# Altium schematic sheet MCU_WASH_MACHINE.SchDoc (part 2 of 3)
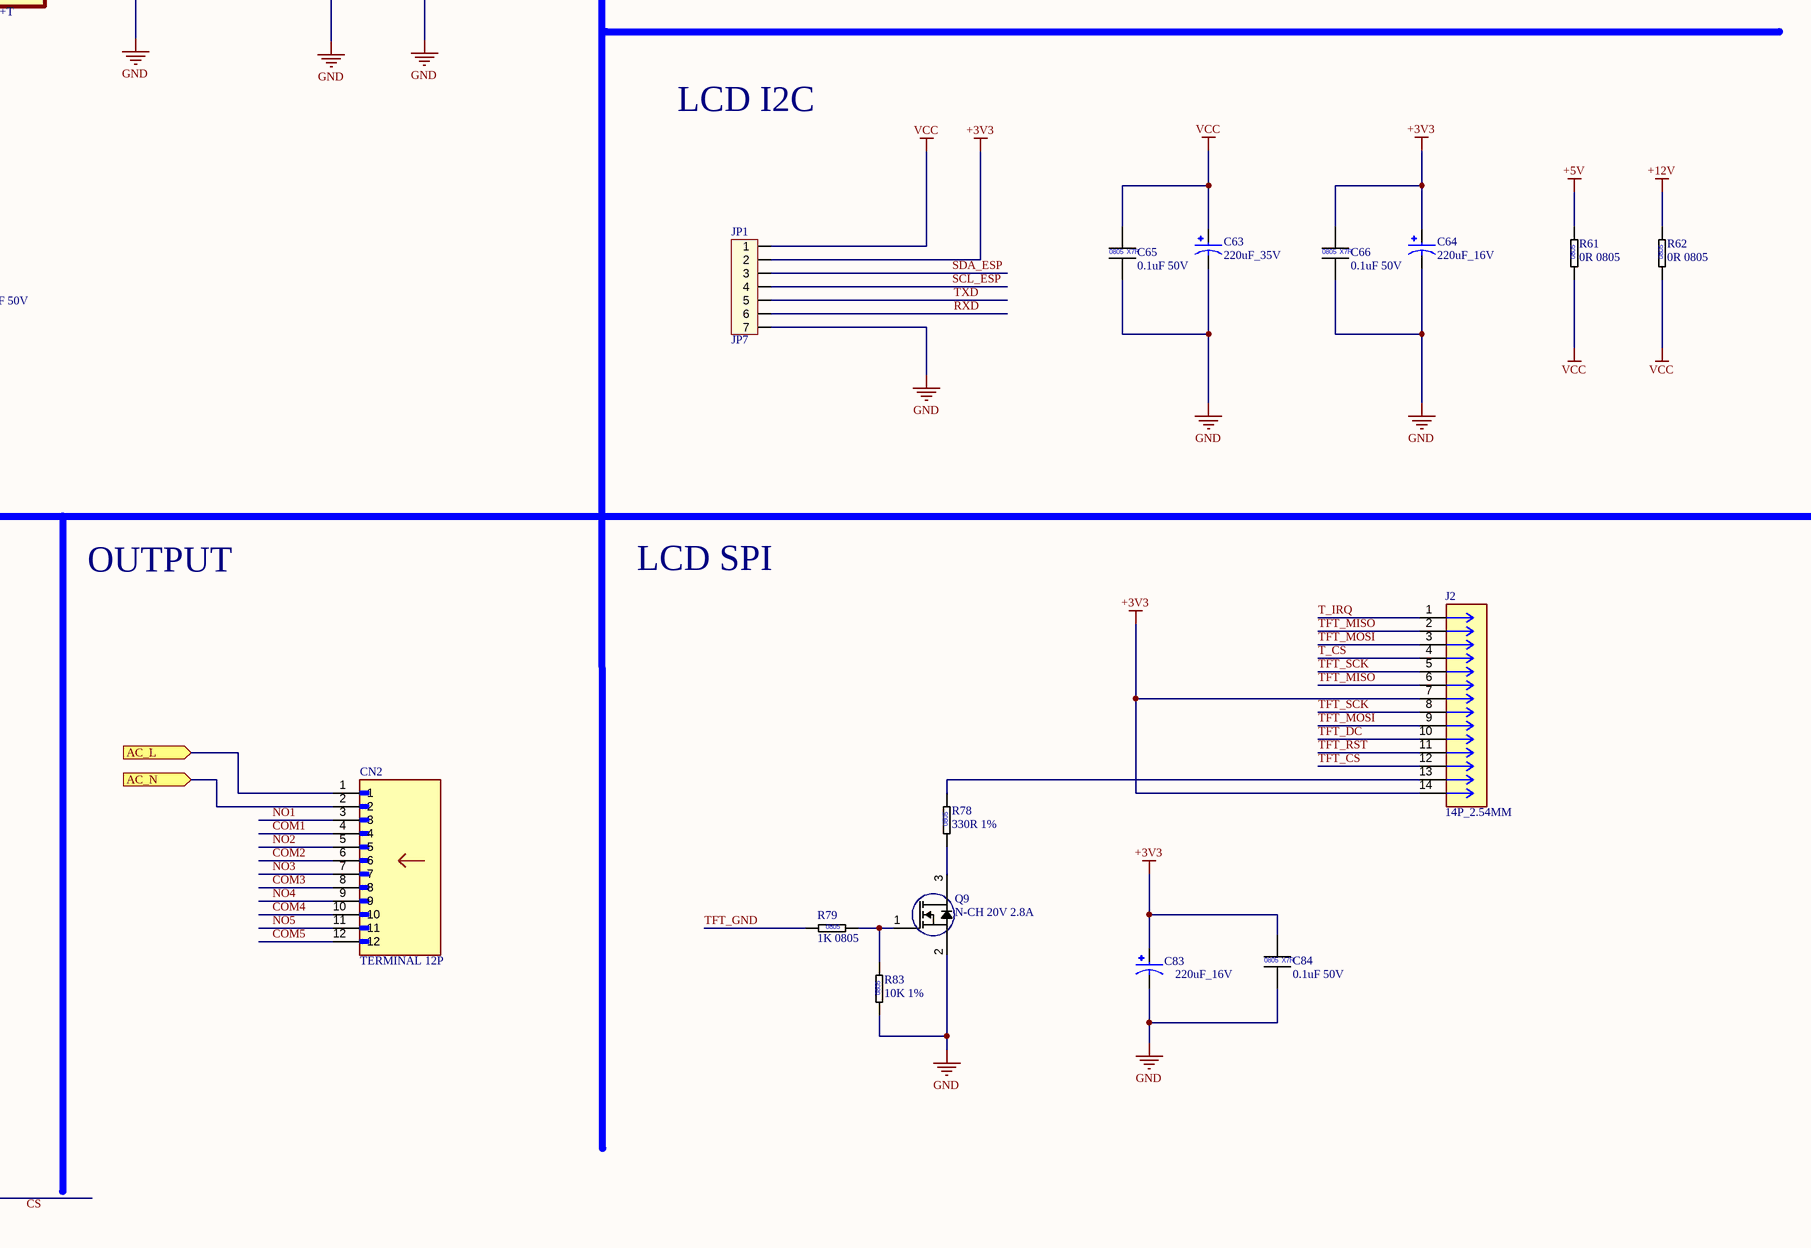
[diagram p8: MCU_WASH_MACHINE.SchDoc, bottom column 4 of 4]
## Library data of the parts
AT1 = Antenna_IPEX: Antenna
BH1 = BATT_HOLDER_SMD; BATTERY HOLDER COIN 12.5MM; 1056: Battery Holder, SMT, 1 Coin Cell, 12mm, Plastic, UL94V-0 | Keystone Electronics 1056; Manufacturer Part Number: 1056; Number of Batteries: 1; LIBRARY MADE BY: MR. XUAN SIEU; Supplier 1: DigiKey; Manufacturer: Keystone; RoHS: Compliant; Category: Batteries and Accessories; Stock 1: 79944; Pricing 1: 1=1.1, 1000=0.41, 2500=0.38, 5000=0.35 (USD); Color: Black; Lead Free: Lead Free; Lifecycle Status: Production; Max Operating Temperature: 145°C; Min Operating Temperature: -50°C; Mount: PCB, Surface Mount; Number of Cells: 1; REACH SVHC: Yes; Termination: SMD/SMT; ComponentLink1URL: https://datasheet.octopart.com:443/1056-Keystone-datasheet-15715033.pdf?src-supplier=Future+Electronics; ComponentLink1Description: https://datasheet.octopart.com:443/1056-Keystone-datasheet-15715033.pdf?src-supplier=Future+Electronics; ComponentLink2URL: https://datasheet.octopart.com:443/1056-Keystone-datasheet-8326175.pdf?src-supplier=Future+Electronics; ComponentLink2Description: https://datasheet.octopart.com:443/1056-Keystone-datasheet-8326175.pdf?src-supplier=Future+Electronics; ComponentLink3URL: https://datasheet.octopart.com:443/1056-Keystone-datasheet-137916583.pdf?src-supplier=LKR; ComponentLink3Description: https://datasheet.octopart.com:443/1056-Keystone-datasheet-137916583.pdf?src-supplier=LKR; ComponentLink4URL: https://datasheet.octopart.com:443/1056-Keystone-datasheet-137320296.pdf?src-supplier=Sager+Electronics; ComponentLink4Description: https://datasheet.octopart.com:443/1056-Keystone-datasheet-137320296.pdf?src-supplier=Sager+Electronics; ComponentLink5URL: https://datasheet.octopart.com:443/1056-Keystone-datasheet-62112666.pdf?src-supplier=RS+(Formerly+Allied+Electronics); ComponentLink5Description: https://datasheet.octopart.com:443/1056-Keystone-datasheet-62112666.pdf?src-supplier=RS+(Formerly+Allied+Electronics); ComponentLink6URL: https://datasheet.octopart.com:443/1056-Keystone-datasheet-21202752.pdf?src-supplier=Newark; ComponentLink6Description: https://datasheet.octopart.com:443/1056-Keystone-datasheet-21202752.pdf?src-supplier=Newark; ComponentLink7URL: https://datasheet.octopart.com:443/1056-Keystone-datasheet-17577351.pdf?src-supplier=TME; ComponentLink7Description: https://datasheet.octopart.com:443/1056-Keystone-datasheet-17577351.pdf?src-supplier=TME; ComponentLink8URL: https://datasheet.octopart.com:443/1056-Keystone-datasheet-176783336.pdf?src-supplier=SOS+electronic; ComponentLink8Description: https://datasheet.octopart.com:443/1056-Keystone-datasheet-176783336.pdf?src-supplier=SOS+electronic; Supplier Part Number 1: 36-1056-ND; LINK VIET NAM: https://linhkien.cxtvn.com/1651-de-pin-cr1220-3v-han-dan.html; LINK ORIGINAL: https://www.digikey.com/en/products/detail/keystone-electronics/1056/2020198
C16 = CAP_CER_SMD; 10PF 50V C0G/NP0 0805 2.5%: Cap Ceramic 10pF 50V C0G 0.25pF Pad SMD 0805 125°C T/R; Manufacturer: Samsung Electro-Mechanics; Manufacturer Part Number: CL21C100CBANNNC; Temperature Coefficient: 30ppm/°C; Tolerance: 5%; LIBRARY MADE BY: MR. XUAN SIEU; Supplier 1: DigiKey; RoHS: Compliant; Category: Ceramic Capacitors; Stock 1: 78846; Pricing 1: 1=0.1, 10=0.044, 50=0.0302, 100=0.026, 500=0.0169, 1000=0.01376 (USD); Capacitance: 10pF; Case/Package: 0805; Case Code (Imperial): 0805; Case Code (Metric): 2012; China RoHS: Compliant; Depth: 1.25mm; Dielectric: C0G; Dielectric Material: Ceramic; Height: 650µm; Length: 2mm; Lifecycle Status: Production; Material: Ceramic; Max Operating Temperature: 125°C; Min Operating Temperature: -55°C; Mount: Surface Mount; Number of Terminals: 2; Radiation Hardening: No; REACH SVHC: Yes; Schedule B: 8532240020, 8532240020|8532240020, 8532240020|8532240020|8532240020, 8532240020|8532240020|8532240020|8532240020; Thickness: 762µm; Voltage: 50V; Voltage Rating: 50V; Voltage Rating (DC): 50V; Width: 1.25mm; ComponentLink1URL: https://datasheet.octopart.com:443/CL21C100CBANNNC-Samsung-Electro-Mechanics-datasheet-136551476.pdf?src-supplier=IHS; ComponentLink1Description: https://datasheet.octopart.com:443/CL21C100CBANNNC-Samsung-Electro-Mechanics-datasheet-136551476.pdf?src-supplier=IHS; ComponentLink2URL: https://datasheet.octopart.com:443/CL21C100CBANNNC-Samsung-Electro-Mechanics-datasheet-149066775.pdf?src-supplier=Future+Electronics; ComponentLink2Description: https://datasheet.octopart.com:443/CL21C100CBANNNC-Samsung-Electro-Mechanics-datasheet-149066775.pdf?src-supplier=Future+Electronics; ComponentLink3URL: https://datasheet.octopart.com:443/CL21C100CBANNNC-Samsung-Electro-Mechanics-datasheet-110334009.pdf?src-supplier=Future+Electronics; ComponentLink3Description: https://datasheet.octopart.com:443/CL21C100CBANNNC-Samsung-Electro-Mechanics-datasheet-110334009.pdf?src-supplier=Future+Electronics; ComponentLink4URL: https://datasheet.octopart.com:443/CL21C100CBANNNC-Samsung-Electro-Mechanics-datasheet-101746655.pdf?src-supplier=Future+Electronics; ComponentLink4Description: https://datasheet.octopart.com:443/CL21C100CBANNNC-Samsung-Electro-Mechanics-datasheet-101746655.pdf?src-supplier=Future+Electronics; ComponentLink5URL: https://datasheet.octopart.com/CL21C100CBANNNC-Samsung-Electro-Mechanics-datasheet-97040617.pdf; ComponentLink5Description: https://datasheet.octopart.com/CL21C100CBANNNC-Samsung-Electro-Mechanics-datasheet-97040617.pdf; ComponentLink6URL: https://datasheet.octopart.com/CL21C100CBANNNC-Samsung-Electro-Mechanics-datasheet-8324245.pdf; ComponentLink6Description: https://datasheet.octopart.com/CL21C100CBANNNC-Samsung-Electro-Mechanics-datasheet-8324245.pdf; ComponentLink7URL: https://datasheet.octopart.com/General-Multilayer-Ceramic-Capacitors-Samsung-datasheet-family-111.pdf; ComponentLink7Description: https://datasheet.octopart.com/General-Multilayer-Ceramic-Capacitors-Samsung-datasheet-family-111.pdf; ComponentLink8URL: https://datasheet.octopart.com:443/CL21C100CBANNNC-Samsung-datasheet-8326407.pdf?src-supplier=TME; ComponentLink8Description: https://datasheet.octopart.com:443/CL21C100CBANNNC-Samsung-datasheet-8326407.pdf?src-supplier=TME; ComponentLink9URL: http://sigma.octopart.com:80/rohs_certificate/General-Multilayer-Ceramic-Capacitors-Samsung-family-110.pdf?src-supplier=Compliance+Statements; ComponentLink9Description: http://sigma.octopart.com:80/rohs_certificate/General-Multilayer-Ceramic-Capacitors-Samsung-family-110.pdf?src-supplier=Compliance+Statements; ComponentLink10URL: http://sigma.octopart.com:80/rohs_statement/General-Multilayer-Ceramic-Capacitors-Samsung-family-132.pdf?src-supplier=Compliance+Statements; ComponentLink10Description: http://sigma.octopart.com:80/rohs_statement/General-Multilayer-Ceramic-Capacitors-Samsung-family-132.pdf?src-supplier=Compliance+Statements; ComponentLink11URL: http://sigma.octopart.com:80/reach_statement/General-Multilayer-Ceramic-Capacitors-Samsung-family-133.pdf?src-supplier=Compliance+Statements; ComponentLink11Description: http://sigma.octopart.com:80/reach_statement/General-Multilayer-Ceramic-Capacitors-Samsung-family-133.pdf?src-supplier=Compliance+Statements; Supplier Part Number 1: 1276-2561-1-ND; LINK VIET NAM: https://linhkien.cxtvn.com/4872-tu-khong-phan-cuc-0805.html; LINK ORIGINAL: https://www.digikey.com/en/products/detail/samsung-electro-mechanics/CL21C100CBANNNC/3888219
C17 = CAP_CER_SMD; 33PF 50V C0G/NP0 0805 10%: Cap Ceramic 33pF (330) 50V C0G 10% SMD 0805 125C Paper T/R; Manufacturer Cross: KEMET; Manufacturer Part Number: C0805C330K5GACTU; Material: 4241ConductorMaterial; Dissipation Factor: 0.1%; Temperature Coefficient: 30ppm/°C; LIBRARY MADE BY: MR. XUAN SIEU; Supplier 1: Digikey; RoHS: Yes; Category: Ceramic Capacitors; Stock 1: 67884; Pricing 1: 1=0.1, 10=0.09, 100=0.0688, 1000=0.0514 (USD); Mount: Surface Mount; Case/Package: 0805; Case Code (Metric): 2012; Case Code (Imperial): 0805; Dielectric Material: 4241ConductorMaterial; Min Operating Temperature: -55°C; Max Operating Temperature: 125°C; Capacitance: 33pF; Package Quantity: 4000; Voltage Rating: 50V; Voltage Rating (DC): 50V; Tolerance: 10%; Packaging: Tape and Reel; Dielectric: C0G; Termination: SMD/SMT; Series: C; Construction: Flat; Length: 2mm; Width: 0.049inch; Height: 0.78mm; Thickness: 0.035inch; Lead Pitch: 0.75mm; Depth: 1.25mm; Radiation Hardening: No; Reach SVHC Compliant: No; RoHS Compliant: Yes; Lead Free: 5697LeadFree; ComponentLink1URL: https://datasheet.ciiva.com/26948/getdatasheetpartid-780465-26948481.pdf?src-supplier=Verical; ComponentLink1Description: https://datasheet.ciiva.com/26948/getdatasheetpartid-780465-26948481.pdf?src-supplier=Verical; ComponentLink2Description: Link Original; ComponentLink2URL: https://www.digikey.com/en/products/detail/kemet/C0805C330K5GACTU/2212525; ComponentLink3Description: Link Cross; ComponentLink3URL: https://www.lcsc.com/product-detail/Multilayer-Ceramic-Capacitors-MLCC-SMD-SMT_KEMET-C0805C330K5GACTU_C2169038.html?s_z=n_C0805C330K5GACTU; ComponentLink4Description: Link Viet Nam; ComponentLink4URL: https://linhkien.cxtvn.com/3499-tu-330-33pf-0805-50v-10c.html; Supplier Part Number 1: 399-C0805C330K5GACTUCT-ND
C18 C21 C35 C67 C71 C78 C82 = CAP_CER_SMD; 1000PF 50V X7R 0805 10%: 1000 pF (102,1nF) ±10% 50V Ceramic Capacitor X7R 0805 (2012 Metric),; Manufacturer Cross: KEMET; Manufacturer Part Number: C0805C102K5RACTU; Dielectric Material: 4241ConductorMaterial; Temperature Coefficient: 30ppm/°C; LIBRARY MADE BY: MR. XUAN SIEU; Supplier 1: Digikey; RoHS: Yes; Category: Ceramic Capacitors; Stock 1: 269175; Pricing 1: 1=0.11, 10=0.061, 50=0.042, 100=0.0362, 500=0.02634, 1000=0.02329, 4000=0.01874, 8000=0.01701, 12000=0.01614, 20000=0.01517, 28000=0.0146, 40000=0.01406, 100000=0.01287, 200000=0.01215, 400000=0.01155 (USD); Mount: Surface Mount,PCB; Case/Package: 0805; Number of Pins: 2; Case Code (Imperial): 0805; Case Code (Metric): 2012; Material: 4241ConductorMaterial; Min Operating Temperature: -55°C; Max Operating Temperature: 125°C; Tolerance: 10%; Packaging: Tape and Reel; Capacitance: 1nF; Dielectric: X7R; Voltage: 50V; Series: SMD Comm X7R; Voltage Rating: 50V; Package Quantity: 4000; Termination: SMD/SMT; Construction: Flat; Voltage Rating (DC): 50V; Length: 2mm; Width: 1.25mm; Height: 0.78mm; Depth: 1.25mm; Lead Pitch: 0.75mm; Thickness: 889um; Radiation Hardening: No; Reach SVHC Compliant: No; RoHS Compliant: Yes; Lead Free: 5697LeadFree; ComponentLink1URL: https://www.distrelec.biz/Web/Downloads/_t/ds/KEM_C1002_X7R_SMD_eng_tds.pdf?mime=application%2Fpdf&src-supplier=Distrelec; ComponentLink1Description: https://www.distrelec.biz/Web/Downloads/_t/ds/KEM_C1002_X7R_SMD_eng_tds.pdf?mime=application%2Fpdf&src-supplier=Distrelec; ComponentLink2URL: http://www.farnell.com/datasheets/2740679.pdf?src-supplier=Farnell; ComponentLink2Description: http://www.farnell.com/datasheets/2740679.pdf?src-supplier=Farnell; ComponentLink3URL: http://www.onlinecomponents.com/productFiles/mf-KEM/kem_c1002_x7r_smd.pdf?src-supplier=Onlinecomponents.com; ComponentLink3Description: http://www.onlinecomponents.com/productFiles/mf-KEM/kem_c1002_x7r_smd.pdf?src-supplier=Onlinecomponents.com; ComponentLink4URL: http://www.farnell.com/datasheets/2740679.pdf?src-supplier=Element14; ComponentLink4Description: http://www.farnell.com/datasheets/2740679.pdf?src-supplier=Element14; ComponentLink5URL: https://datasheet.octopart.com/C0805C102K5RACTU-Kemet-datasheet-24570007.pdf?src-supplier=Element14; ComponentLink5Description: https://datasheet.octopart.com/C0805C102K5RACTU-Kemet-datasheet-24570007.pdf?src-supplier=Element14; ComponentLink6URL: https://api.kemet.com/component-edge/download/datasheet/C0805C102K5RACTU.pdf?src-supplier=Digikey; ComponentLink6Description: https://api.kemet.com/component-edge/download/datasheet/C0805C102K5RACTU.pdf?src-supplier=Digikey; ComponentLink7URL: http://www.farnell.com/datasheets/2740679.pdf?src-supplier=Newark; ComponentLink7Description: http://www.farnell.com/datasheets/2740679.pdf?src-supplier=Newark; ComponentLink8URL: https://www.alliedelec.com/m/d/9bfe7773041ffe9d406e68bc7b377fdd.pdf?src-supplier=Allied+Electronics; ComponentLink8Description: https://www.alliedelec.com/m/d/9bfe7773041ffe9d406e68bc7b377fdd.pdf?src-supplier=Allied+Electronics; Supplier Part Number 1: 399-C0805C102K5RACTUCT-ND; ComponentLink9Description: Link Viet Nam; ComponentLink9URL: https://linhkien.cxtvn.com/3023-tu-khong-phan-cuc-0805.html; ComponentLink10Description: Link Cross; ComponentLink10URL: https://www.lcsc.com/product-detail/Multilayer-Ceramic-Capacitors-MLCC-SMD-SMT_KEMET-C0805C102K5RACTU_C2167366.html?s_z=n_C0805C102K5RACTU; ComponentLink11Description: Link Original; ComponentLink11URL: https://www.digikey.com/en/products/detail/kemet/C0805C102K5RACTU/411146
C19 C24 C25 C27 C33 C38 C39 C42 C44-C50 C52-C54 C56 C58 C60 C65 C66 C69 C70 C73 C77 C80 C84 C86 = CAP_CER_SMD; 0.1UF 50V X7R 0805 10%: 0.1 (104) µF ±10% 50V Ceramic Capacitor X7R 0805 (2012 Metric); Manufacturer Cross: Yageo; Manufacturer Part Number: CC0805KRX7R9BB104; Capacitance: 100nF; Insulation Resistance: 100GR; LIBRARY MADE BY: MR. XUAN SIEU; Supplier 1: Digikey; RoHS: Yes; Category: Ceramic Capacitors; Stock 1: 3664790; Pricing 1: 1=0.08, 10=0.032, 100=0.026, 1000=0.02, 4000=0.0176, 8000=0.01595, 12000=0.01512, 20000=0.0142, 28000=0.01367, 40000=0.01315, 100000=0.01202, 200000=0.01134, 400000=0.01077 (USD); Mount: Surface Mount; Case/Package: 0805; Number of Pins: 2; Case Code (Metric): 2012; Case Code (Imperial): 0805; Material: Ceramic; Min Operating Temperature: -55°C; Max Operating Temperature: 125°C; Packaging: Tape and Reel; Tolerance: 10%; Voltage Rating: 50V; Package Quantity: 4000; Dielectric: X7R; Termination: SMD/SMT; Voltage: 50V; Series: CC; Length: 2mm; Height: 0.85mm; Depth: 1.25mm; Radiation Hardening: No; Reach SVHC Compliant: No; RoHS Compliant: Yes; Lead Free: 5697LeadFree; Halogen Free: 5694HalogenFree; ComponentLink1URL: https://datasheet.ciiva.com/46393/1734573-46393307.pdf?src-supplier=Element14; ComponentLink1Description: https://datasheet.ciiva.com/46393/1734573-46393307.pdf?src-supplier=Element14; ComponentLink2URL: https://datasheet.ciiva.com/155/mlccorderingcode-155930.pdf?src-supplier=Digikey; ComponentLink2Description: https://datasheet.ciiva.com/155/mlccorderingcode-155930.pdf?src-supplier=Digikey; ComponentLink3URL: https://datasheet.ciiva.com/29242/445210-da-01-en-kerko-chip-0805-x7r-0-1uf-10proz-50vg-29242074.pdf?src-supplier=Conrad; ComponentLink3Description: https://datasheet.ciiva.com/29242/445210-da-01-en-kerko-chip-0805-x7r-0-1uf-10proz-50vg-29242074.pdf?src-supplier=Conrad; ComponentLink4Description: Link Cross; ComponentLink4URL: https://www.lcsc.com/product-detail/Multilayer-Ceramic-Capacitors-MLCC-SMD-SMT_YAGEO-CC0805KRX7R9BB104_C49678.html?s_z=n_CC0805KRX7R9BB104; ComponentLink5Description: Link Viet Nam; ComponentLink5URL: https://linhkien.cxtvn.com/1976-tu-khong-phan-cuc-0805.html; ComponentLink6Description: Link Original; ComponentLink6URL: https://www.digikey.com/en/products/detail/yageo/CC0805KRX7R9BB104/302874; Supplier Part Number 1: 311-1140-1-ND
C20 = CAP_CER_SMD; 1UF 50V X7R 0805 10%: Cap Ceramic 1uF 50V X7R 10% SMD 0805 125°C Embossed Plastic T/R; Manufacturer Cross: Samsung; Manufacturer Part Number: CL21B105KBFNNNG; LIBRARY MADE BY: MR. XUAN SIEU; Supplier 1: Digikey; RoHS: Yes; Category: Ceramic Capacitors; Stock 1: 238551; Pricing 1: 1=0.11, 10=0.06, 100=0.0358, 1000=0.02348 (USD); Mount: Surface Mount; Case/Package: 0805; Case Code (Metric): 2012; Case Code (Imperial): 0805; Material: Ceramic; Min Operating Temperature: -55°C; Max Operating Temperature: 125°C; Tolerance: 10%; Packaging: Tape and Reel; Capacitance: 1uF; Voltage Rating: 50V; Series: CL; Dielectric: X7R; Voltage Rating (DC): 50V; Package Quantity: 3000; Voltage: 50V; Length: 0.079inch; Width: 0.049inch; Thickness: 0.053inch; Depth: 1.25mm; RoHS Compliant: Yes; ComponentLink1URL: https://datasheet.ciiva.com/25733/cl21b105kbfnnng-25733278.pdf?src-supplier=Digikey; ComponentLink1Description: https://datasheet.ciiva.com/25733/cl21b105kbfnnng-25733278.pdf?src-supplier=Digikey; ComponentLink2URL: https://datasheet.ciiva.com/29199/455898-da-01-en-vs-kondensator-0805-29199201.pdf?src-supplier=Conrad; ComponentLink2Description: https://datasheet.ciiva.com/29199/455898-da-01-en-vs-kondensator-0805-29199201.pdf?src-supplier=Conrad; ComponentLink3URL: https://datasheet.ciiva.com/26310/mlcc-catalogdownload2013-eng-26310125.pdf?src-supplier=Distrelec; ComponentLink3Description: https://datasheet.ciiva.com/26310/mlcc-catalogdownload2013-eng-26310125.pdf?src-supplier=Distrelec; ComponentLink4URL: https://datasheet.ciiva.com/16428/cl05b104kq5nnnc-16428872.pdf?src-supplier=Future+Electronics; ComponentLink4Description: https://datasheet.ciiva.com/16428/cl05b104kq5nnnc-16428872.pdf?src-supplier=Future+Electronics; ComponentLink5Description: Link Original; ComponentLink5URL: https://www.digikey.com/en/products/detail/samsung-electro-mechanics/CL21B105KBFNNNG/3894467?s=N4IgTCBcDaIMIBkwEYBCyAMBWA0qgYgHLEDiIAugL5A; ComponentLink6Description: Link Cross; ComponentLink6URL: https://www.lcsc.com/product-detail/Multilayer-Ceramic-Capacitors-MLCC-SMD-SMT_Samsung-Electro-Mechanics-CL21B105KBFNNNE_C28323.html?s_z=n_CL21B105KBFNNNG; ComponentLink7Description: Link Viet Nam; ComponentLink7URL: https://linhkien.cxtvn.com/6335-c0805c105k5pac7800-cap-cer-1uf-50v-10-x5r-0805.html; Supplier Part Number 1: 1276-6470-1-ND
C22 = CAPCER0094 0805 0.22uF/25V 220nF: CAP CER 0.22uF/25V 10% X7R 0805 SMD; LINE: SMT; UNIT: PCS; CERT: NA; CLASS: B; DESIGN MADE: Huy Cao Keu; MOUNT: SMD
C23 C26 C55 C57 C59 C68 C74 C76 C79 C81 = CAP_CER_SMD; 10UF 25V X5R 0805 10%: 10 µF ±10% 25V Ceramic Capacitor X5R 0805 (2012 Metric); Manufacturer Cross: Murata; Manufacturer Part Number: GRM21BR61E106KA73L; LIBRARY MADE BY: MR. XUAN SIEU; Supplier 1: Digikey; RoHS: Yes; Category: Ceramic Capacitors; Stock 1: 1799838; Pricing 1: 1=0.2, 10=0.086, 50=0.0696, 100=0.0528, 500=0.0484, 1000=0.044 (USD); Mount: Surface Mount; Case/Package: 0805; Case Code (Metric): 2012; Case Code (Imperial): 0805; Material: Ceramic; Min Operating Temperature: -55°C; Max Operating Temperature: 85°C; Package Quantity: 1; Capacitance: 10uF; Voltage Rating: 25V; Tolerance: 10%; Packaging: Tape and Reel; Voltage Rating (DC): 25V; Dielectric: X5R; Termination: SMD/SMT; Voltage: 25V; Series: GRM; Construction: Flat; Length: 2mm; Width: 0.049inch; Height: 1.25mm; Thickness: 0.053inch; Depth: 1.25mm; Reach SVHC Compliant: No; RoHS Compliant: Yes; Lead Free: 5697LeadFree; ComponentLink1URL: https://datasheet.ciiva.com/22774/1747469-22774396.pdf?src-supplier=Farnell; ComponentLink1Description: https://datasheet.ciiva.com/22774/1747469-22774396.pdf?src-supplier=Farnell; ComponentLink2URL: https://datasheet.ciiva.com/28584/626718-28584288.pdf?src-supplier=Element14; ComponentLink2Description: https://datasheet.ciiva.com/28584/626718-28584288.pdf?src-supplier=Element14; ComponentLink3URL: https://datasheet.ciiva.com/5424/product-5424327.pdf?src-supplier=Mouser; ComponentLink3Description: https://datasheet.ciiva.com/5424/product-5424327.pdf?src-supplier=Mouser; ComponentLink4URL: https://datasheet.ciiva.com/29199/454623-da-01-en-vs-kondensator-0805-29199615.pdf?src-supplier=Conrad; ComponentLink4Description: https://datasheet.ciiva.com/29199/454623-da-01-en-vs-kondensator-0805-29199615.pdf?src-supplier=Conrad; ComponentLink5URL: https://datasheet.ciiva.com/14116/grmseries-highdielectrictype-eng-14116376.pdf?src-supplier=Distrelec; ComponentLink5Description: https://datasheet.ciiva.com/14116/grmseries-highdielectrictype-eng-14116376.pdf?src-supplier=Distrelec; ComponentLink6URL: https://datasheet.ciiva.com/7719/1747469-7719093.pdf?src-supplier=Element14; ComponentLink6Description: https://datasheet.ciiva.com/7719/1747469-7719093.pdf?src-supplier=Element14; ComponentLink7URL: https://datasheet.ciiva.com/28584/626718-28584279.pdf?src-supplier=Element14; ComponentLink7Description: https://datasheet.ciiva.com/28584/626718-28584279.pdf?src-supplier=Element14; ComponentLink8URL: https://datasheet.ciiva.com/139/partnumbering-e-01-139183.pdf?src-supplier=Digikey; ComponentLink8Description: https://datasheet.ciiva.com/139/partnumbering-e-01-139183.pdf?src-supplier=Digikey; ComponentLink9URL: https://datasheet.ciiva.com/139/partnumbering-e-01-139182.pdf?src-supplier=Digikey; ComponentLink9Description: https://datasheet.ciiva.com/139/partnumbering-e-01-139182.pdf?src-supplier=Digikey; ComponentLink10URL: https://datasheet.ciiva.com/139/partnumbering-e-01-139184.pdf?src-supplier=Digikey; ComponentLink10Description: https://datasheet.ciiva.com/139/partnumbering-e-01-139184.pdf?src-supplier=Digikey; Supplier Part Number 1: 490-5523-6-ND; ComponentLink11Description: Link Viet Nam; ComponentLink11URL: https://linhkien.cxt.vn/5861-tmk212bbj106mg-t-cap-cer-10uf-25v-x5r-0805.html; ComponentLink12Description: Link Original; ComponentLink12URL: https://www.digikey.com/en/products/detail/murata-electronics/GRM21BR61E106KA73L/2334874; ComponentLink13Description: Link Cross; ComponentLink13URL: https://www.lcsc.com/product-detail/Multilayer-Ceramic-Capacitors-MLCC-SMD-SMT_Murata-Electronics-GRM21BR61E106KA73L_C84416.html
C28 C29 = CAP_CER_SMD; 6.8nF 50V C0G/NP0 0805 5%: Capacitor; Ceramic; Cap; 6.8nF; Tol 5%; SMT; Vol-Rtg 50V; C0G; Tape and Reel | KEMET C0805C220J5GACTU; Capacitance: 22pF; LIBRARY MADE BY: MR. XUAN SIEU; Supplier 1: Digikey; Manufacturer Cross: KEMET; Manufacturer Part Number: C0805C220J5GACTU; RoHS: Yes; Category: Ceramic Capacitors; Stock 1: 208649; Pricing 1: 1=0.1, 10=0.042, 100=0.0243, 1000=0.0194, 4000=0.01203, 8000=0.01082, 12000=0.01022, 20000=0.01004, 28000=0.00958, 40000=0.00932, 100000=0.00858, 200000=0.00772 (USD); Mount: Surface Mount,PCB; Case/Package: 0805; Case Code (Metric): 2012; Case Code (Imperial): 0805; Weight: 0.000194oz; Contact Material: Tin; Contact Plating: Tin,Matte; Material: Ceramic; Min Operating Temperature: -55°C; Max Operating Temperature: 125°C; Packaging: Tape and Reel; Tolerance: 5%; Voltage Rating: 50V; Voltage Rating (DC): 50V; Dielectric: C0G; Termination: SMD/SMT; Voltage: 50V; Series: SMD Comm C0G; Construction: Flat; Length: 2mm; Width: 1.25mm; Height: 0.78mm; Depth: 1.25mm; Radiation Hardening: No; Reach SVHC Compliant: No; Lead Free: Lead Free; RoHS Compliant: Yes; ComponentLink1URL: https://datasheet.ciiva.com/7842/1732694-7842250.pdf?src-supplier=Element14; ComponentLink1Description: https://datasheet.ciiva.com/7842/1732694-7842250.pdf?src-supplier=Element14; ComponentLink2URL: https://datasheet.ciiva.com/7842/1372242-7842570.pdf?src-supplier=Element14; ComponentLink2Description: https://datasheet.ciiva.com/7842/1372242-7842570.pdf?src-supplier=Element14; ComponentLink3URL: https://datasheet.ciiva.com/7842/1732694-7842251.pdf?src-supplier=Element14; ComponentLink3Description: https://datasheet.ciiva.com/7842/1732694-7842251.pdf?src-supplier=Element14; ComponentLink4URL: https://datasheet.ciiva.com/7842/kem-c1003-c0g-smd-7842569.pdf?src-supplier=Element14; ComponentLink4Description: https://datasheet.ciiva.com/7842/kem-c1003-c0g-smd-7842569.pdf?src-supplier=Element14; ComponentLink5URL: https://datasheet.ciiva.com/28668/1789732-28668761.pdf?src-supplier=Element14; ComponentLink5Description: https://datasheet.ciiva.com/28668/1789732-28668761.pdf?src-supplier=Element14; ComponentLink6Description: Link Cross; ComponentLink6URL: https://www.lcsc.com/product-detail/Multilayer-Ceramic-Capacitors-MLCC-SMD-SMT_KEMET-C0805C220J2GACTU_C1620086.html?s_z=n_C0805C220J5GACTU; ComponentLink7Description: Link Viet Nam; ComponentLink7URL: https://linhkien.cxtvn.com/1061-tu-220-22pf-0805-50v-5-10c.html; ComponentLink8Description: Link Original; ComponentLink8URL: https://www.digikey.com/en/products/detail/kemet/C0805C220J5GACTU/411112; Supplier Part Number 1: 399-C0805C220J5GACTUCT-ND
C30-C32 = CAP_CER_SMD; 22PF 50V C0G/NP0 0805 5%_1: Capacitor; Ceramic; Cap; 22.0pF; Tol 5%; SMT; Vol-Rtg 50V; C0G; Tape and Reel | KEMET C0805C220J5GACTU; LIBRARY MADE BY: MR. XUAN SIEU; Supplier 1: Digikey; Manufacturer Cross: KEMET; Manufacturer Part Number: C0805C220J5GACTU; RoHS: Yes; Category: Ceramic Capacitors; Stock 1: 208649; Pricing 1: 1=0.1, 10=0.042, 100=0.0243, 1000=0.0194, 4000=0.01203, 8000=0.01082, 12000=0.01022, 20000=0.01004, 28000=0.00958, 40000=0.00932, 100000=0.00858, 200000=0.00772 (USD); Mount: Surface Mount,PCB; Case/Package: 0805; Case Code (Metric): 2012; Case Code (Imperial): 0805; Weight: 0.000194oz; Contact Material: Tin; Contact Plating: Tin,Matte; Material: Ceramic; Min Operating Temperature: -55°C; Max Operating Temperature: 125°C; Packaging: Tape and Reel; Capacitance: 22pF; Tolerance: 5%; Voltage Rating: 50V; Voltage Rating (DC): 50V; Dielectric: C0G; Termination: SMD/SMT; Voltage: 50V; Series: SMD Comm C0G; Construction: Flat; Length: 2mm; Width: 1.25mm; Height: 0.78mm; Depth: 1.25mm; Radiation Hardening: No; Reach SVHC Compliant: No; Lead Free: Lead Free; RoHS Compliant: Yes; ComponentLink1URL: https://datasheet.ciiva.com/7842/1732694-7842250.pdf?src-supplier=Element14; ComponentLink1Description: https://datasheet.ciiva.com/7842/1732694-7842250.pdf?src-supplier=Element14; ComponentLink2URL: https://datasheet.ciiva.com/7842/1372242-7842570.pdf?src-supplier=Element14; ComponentLink2Description: https://datasheet.ciiva.com/7842/1372242-7842570.pdf?src-supplier=Element14; ComponentLink3URL: https://datasheet.ciiva.com/7842/1732694-7842251.pdf?src-supplier=Element14; ComponentLink3Description: https://datasheet.ciiva.com/7842/1732694-7842251.pdf?src-supplier=Element14; ComponentLink4URL: https://datasheet.ciiva.com/7842/kem-c1003-c0g-smd-7842569.pdf?src-supplier=Element14; ComponentLink4Description: https://datasheet.ciiva.com/7842/kem-c1003-c0g-smd-7842569.pdf?src-supplier=Element14; ComponentLink5URL: https://datasheet.ciiva.com/28668/1789732-28668761.pdf?src-supplier=Element14; ComponentLink5Description: https://datasheet.ciiva.com/28668/1789732-28668761.pdf?src-supplier=Element14; ComponentLink6Description: Link Cross; ComponentLink6URL: https://www.lcsc.com/product-detail/Multilayer-Ceramic-Capacitors-MLCC-SMD-SMT_KEMET-C0805C220J2GACTU_C1620086.html?s_z=n_C0805C220J5GACTU; ComponentLink7Description: Link Viet Nam; ComponentLink7URL: https://linhkien.cxtvn.com/1061-tu-220-22pf-0805-50v-5-10c.html; ComponentLink8Description: Link Original; ComponentLink8URL: https://www.digikey.com/en/products/detail/kemet/C0805C220J5GACTU/411112; Supplier Part Number 1: 399-C0805C220J5GACTUCT-ND
C34 = CAP_CER_SMD; 22nF 50V C0G/NP0 0805 5%: Capacitor; Ceramic; Cap; 22.0nF; Tol 5%; SMT; Vol-Rtg 50V; C0G; Tape and Reel | KEMET C0805C220J5GACTU; Capacitance: 22pF; LIBRARY MADE BY: MR. XUAN SIEU; Supplier 1: Digikey; Manufacturer Cross: KEMET; Manufacturer Part Number: C0805C220J5GACTU; RoHS: Yes; Category: Ceramic Capacitors; Stock 1: 208649; Pricing 1: 1=0.1, 10=0.042, 100=0.0243, 1000=0.0194, 4000=0.01203, 8000=0.01082, 12000=0.01022, 20000=0.01004, 28000=0.00958, 40000=0.00932, 100000=0.00858, 200000=0.00772 (USD); Mount: Surface Mount,PCB; Case/Package: 0805; Case Code (Metric): 2012; Case Code (Imperial): 0805; Weight: 0.000194oz; Contact Material: Tin; Contact Plating: Tin,Matte; Material: Ceramic; Min Operating Temperature: -55°C; Max Operating Temperature: 125°C; Packaging: Tape and Reel; Tolerance: 5%; Voltage Rating: 50V; Voltage Rating (DC): 50V; Dielectric: C0G; Termination: SMD/SMT; Voltage: 50V; Series: SMD Comm C0G; Construction: Flat; Length: 2mm; Width: 1.25mm; Height: 0.78mm; Depth: 1.25mm; Radiation Hardening: No; Reach SVHC Compliant: No; Lead Free: Lead Free; RoHS Compliant: Yes; ComponentLink1URL: https://datasheet.ciiva.com/7842/1732694-7842250.pdf?src-supplier=Element14; ComponentLink1Description: https://datasheet.ciiva.com/7842/1732694-7842250.pdf?src-supplier=Element14; ComponentLink2URL: https://datasheet.ciiva.com/7842/1372242-7842570.pdf?src-supplier=Element14; ComponentLink2Description: https://datasheet.ciiva.com/7842/1372242-7842570.pdf?src-supplier=Element14; ComponentLink3URL: https://datasheet.ciiva.com/7842/1732694-7842251.pdf?src-supplier=Element14; ComponentLink3Description: https://datasheet.ciiva.com/7842/1732694-7842251.pdf?src-supplier=Element14; ComponentLink4URL: https://datasheet.ciiva.com/7842/kem-c1003-c0g-smd-7842569.pdf?src-supplier=Element14; ComponentLink4Description: https://datasheet.ciiva.com/7842/kem-c1003-c0g-smd-7842569.pdf?src-supplier=Element14; ComponentLink5URL: https://datasheet.ciiva.com/28668/1789732-28668761.pdf?src-supplier=Element14; ComponentLink5Description: https://datasheet.ciiva.com/28668/1789732-28668761.pdf?src-supplier=Element14; ComponentLink6Description: Link Cross; ComponentLink6URL: https://www.lcsc.com/product-detail/Multilayer-Ceramic-Capacitors-MLCC-SMD-SMT_KEMET-C0805C220J2GACTU_C1620086.html?s_z=n_C0805C220J5GACTU; ComponentLink7Description: Link Viet Nam; ComponentLink7URL: https://linhkien.cxtvn.com/1061-tu-220-22pf-0805-50v-5-10c.html; ComponentLink8Description: Link Original; ComponentLink8URL: https://www.digikey.com/en/products/detail/kemet/C0805C220J5GACTU/411112; Supplier Part Number 1: 399-C0805C220J5GACTUCT-ND
C36 C72 = CAP_CER_SMD; 470PF 50V C0G/NP0 0805 5%: 470 pF ±5% 50V Ceramic Capacitor C0G, NP0 0805 (2012 Metric); Manufacturer: Wurth Elektronik; Manufacturer Part Number: 885012007061; Insulation Resistance: 10GΩ; Supplier 1: DigiKey; RoHS: Compliant; Category: Ceramic Capacitors; Stock 1: 9826; Pricing 1: 1=0.15, 10=0.086, 50=0.0604, 100=0.0526, 500=0.03956, 1000=0.03554 (USD); Capacitance: 470pF; Case/Package: 0805; Case Code (Imperial): 0805; Case Code (Metric): 2012; Height: 800µm; Length: 2mm; Max Operating Temperature: 125°C; Min Operating Temperature: -55°C; Mount: Surface Mount; Packaging: Cut Tape; Thickness: 889µm; Tolerance: 5%; Voltage Rating: 50V; Voltage Rating (DC): 50V; Width: 1.25mm; ComponentLink1URL: https://datasheet.octopart.com:443/885012007061-Wurth-Elektronik-datasheet-159617428.pdf?src-supplier=Wurth+Elektronik; ComponentLink1Description: https://datasheet.octopart.com:443/885012007061-Wurth-Elektronik-datasheet-159617428.pdf?src-supplier=Wurth+Elektronik; ComponentLink2URL: https://datasheet.octopart.com:443/885012007061-W%C3%BCrth-Elektronik-datasheet-82513931.pdf?src-supplier=Wurth+Elektronik; ComponentLink2Description: https://datasheet.octopart.com:443/885012007061-W%C3%BCrth-Elektronik-datasheet-82513931.pdf?src-supplier=Wurth+Elektronik; Supplier Part Number 1: 732-7856-1-ND
C37 = CAP_CER_SMD; 100PF 50V C0G/NP0 0805 10%: 100 pF ±5% 50V Ceramic Capacitor C0G, NP0 0805 (2012 Metric); Manufacturer Cross: Samsung; Manufacturer Part Number: CL21C101JBANNNC; LIBRARY MADE BY: MR. XUAN SIEU; Supplier 1: Digikey; RoHS: Yes; Category: Ceramic Capacitors; Stock 1: 43699; Pricing 1: 1=0.1, 10=0.037, 100=0.0216, 1000=0.01368 (USD); Voltage Rating (DC): 50V; Lead Free: 5697LeadFree; RoHS Compliant: 5897YesNo; ComponentLink1URL: https://datasheet.ciiva.com/25710/cl21c101jbannnc-25710193.pdf?src-supplier=Digikey; ComponentLink1Description: https://datasheet.ciiva.com/25710/cl21c101jbannnc-25710193.pdf?src-supplier=Digikey; ComponentLink2URL: https://datasheet.ciiva.com/29199/454082-da-01-en-vs-kondensator-0805-29199900.pdf?src-supplier=Conrad; ComponentLink2Description: https://datasheet.ciiva.com/29199/454082-da-01-en-vs-kondensator-0805-29199900.pdf?src-supplier=Conrad; ComponentLink3Description: Link Original; ComponentLink3URL: https://www.digikey.com/en/products/detail/samsung-electro-mechanics/CL21C101JBANNNC/3886672; ComponentLink4Description: Link Cross; ComponentLink4URL: https://www.lcsc.com/product-detail/Multilayer-Ceramic-Capacitors-MLCC-SMD-SMT_Samsung-Electro-Mechanics-CL21C101JBANNNC_C1790.html?s_z=n_CL21C101JBANNNC; ComponentLink5Description: Link Viet Nam; ComponentLink5URL: https://linhkien.cxtvn.com/3499-tu-330-33pf-0805-50v-10c.html; Supplier Part Number 1: 1276-1014-1-ND
C40 C41 = CAP_CER_SMD; 15pF 25V X5R 0805 20%: 25V 15pF X5R ±20% 0805 Multilayer Ceramic Capacitors MLCC - SMD/SMT ROHS; Manufacturer: Samsung Electro-Mechanics; Manufacturer Part Number: CL21A226MAYNNNE; Capacitance: 22µF; Supplier 1: DigiKey; RoHS: Compliant; Category: Ceramic Capacitors; Stock 1: 818636; Pricing 1: 1=0.24, 10=0.14, 50=0.1004, 100=0.0885, 500=0.06838, 1000=0.06218 (USD); Case/Package: 0805; China RoHS: Compliant; Dielectric: X5R; Dielectric Material: Ceramic; Height: 1.25mm; Length: 2mm; Lifecycle Status: Production; Material: Ceramic; Max Operating Temperature: 85°C; Min Operating Temperature: -55°C; Mount: Surface Mount; Number of Terminals: 2; REACH SVHC: Yes; Schedule B: 8532240020; Tolerance: 20%; Voltage Rating: 25V; Voltage Rating (DC): 25V; Width: 1.25mm; ComponentLink1URL: https://datasheet.octopart.com:443/CL21A226MAYNNNE-Samsung-Electro-Mechanics-datasheet-137343010.pdf?src-supplier=IHS; ComponentLink1Description: https://datasheet.octopart.com:443/CL21A226MAYNNNE-Samsung-Electro-Mechanics-datasheet-137343010.pdf?src-supplier=IHS; ComponentLink2URL: https://datasheet.octopart.com:443/CL21A226MAYNNNE-Samsung-Electro-Mechanics-datasheet-137126787.pdf?src-supplier=Newark; ComponentLink2Description: https://datasheet.octopart.com:443/CL21A226MAYNNNE-Samsung-Electro-Mechanics-datasheet-137126787.pdf?src-supplier=Newark; ComponentLink3URL: https://datasheet.octopart.com/CL21A226MAYNNNE-Samsung-Electro-Mechanics-datasheet-97040617.pdf; ComponentLink3Description: https://datasheet.octopart.com/CL21A226MAYNNNE-Samsung-Electro-Mechanics-datasheet-97040617.pdf; ComponentLink4URL: https://datasheet.octopart.com/CL21A226MAYNNNE-Samsung-Electro-Mechanics-datasheet-8324245.pdf; ComponentLink4Description: https://datasheet.octopart.com/CL21A226MAYNNNE-Samsung-Electro-Mechanics-datasheet-8324245.pdf; ComponentLink5URL: https://datasheet.octopart.com/General-Multilayer-Ceramic-Capacitors-Samsung-datasheet-family-111.pdf; ComponentLink5Description: https://datasheet.octopart.com/General-Multilayer-Ceramic-Capacitors-Samsung-datasheet-family-111.pdf; ComponentLink6URL: https://datasheet.octopart.com:443/CL21A226MAYNNNE-Samsung-datasheet-8326407.pdf?src-supplier=TME; ComponentLink6Description: https://datasheet.octopart.com:443/CL21A226MAYNNNE-Samsung-datasheet-8326407.pdf?src-supplier=TME; ComponentLink7URL: https://datasheet.octopart.com:443/CL21A226MAYNNNE-Samsung-Electro-Mechanics-datasheet-149154243.pdf?src-supplier=Future+Electronics; ComponentLink7Description: https://datasheet.octopart.com:443/CL21A226MAYNNNE-Samsung-Electro-Mechanics-datasheet-149154243.pdf?src-supplier=Future+Electronics; ComponentLink8URL: http://sigma.octopart.com:80/rohs_certificate/General-Multilayer-Ceramic-Capacitors-Samsung-family-110.pdf?src-supplier=Compliance+Statements; ComponentLink8Description: http://sigma.octopart.com:80/rohs_certificate/General-Multilayer-Ceramic-Capacitors-Samsung-family-110.pdf?src-supplier=Compliance+Statements; ComponentLink9URL: http://sigma.octopart.com:80/rohs_statement/General-Multilayer-Ceramic-Capacitors-Samsung-family-132.pdf?src-supplier=Compliance+Statements; ComponentLink9Description: http://sigma.octopart.com:80/rohs_statement/General-Multilayer-Ceramic-Capacitors-Samsung-family-132.pdf?src-supplier=Compliance+Statements; ComponentLink10URL: http://sigma.octopart.com:80/reach_statement/General-Multilayer-Ceramic-Capacitors-Samsung-family-133.pdf?src-supplier=Compliance+Statements; ComponentLink10Description: http://sigma.octopart.com:80/reach_statement/General-Multilayer-Ceramic-Capacitors-Samsung-family-133.pdf?src-supplier=Compliance+Statements; Supplier Part Number 1: 1276-CL21A226MAYNNNECT-ND
C43 C75 = C-ELEC-ALU-SM_1: Aluminum Electrolytic Capacitors - Surface Mount
C51 = CAP_ALU_470uF_35V_SMD: Cap Aluminum Lytic 470uF 35V 20% (10 X 10.2mm) SMD 0.08 Ohm 850mA 2000h 105Â°C Automotive T/R; MF: Panasonic; MP: EEEFK1V471SL; SnapEDA_Link: https://www.snapeda.com/parts/EEEFK1V471SL/Panasonic/view-part/?ref=snap; Package: RADIAL-2 Panasonic; Value: *; Check_prices: https://www.snapeda.com/parts/EEEFK1V471SL/Panasonic/view-part/?ref=eda
C61 C62 = CAP_CER_SMD; 220PF 50V C0G/NP0 0805 10%_1: 220 pF ±5% 50V Ceramic Capacitor C0G, NP0 0805 (2012 Metric); Manufacturer Cross: Samsung; Manufacturer Part Number: CL21C101JBANNNC; LIBRARY MADE BY: MR. XUAN SIEU; Supplier 1: Digikey; RoHS: Yes; Category: Ceramic Capacitors; Stock 1: 43699; Pricing 1: 1=0.1, 10=0.037, 100=0.0216, 1000=0.01368 (USD); Voltage Rating (DC): 50V; Lead Free: 5697LeadFree; RoHS Compliant: 5897YesNo; ComponentLink1URL: https://datasheet.ciiva.com/25710/cl21c101jbannnc-25710193.pdf?src-supplier=Digikey; ComponentLink1Description: https://datasheet.ciiva.com/25710/cl21c101jbannnc-25710193.pdf?src-supplier=Digikey; ComponentLink2URL: https://datasheet.ciiva.com/29199/454082-da-01-en-vs-kondensator-0805-29199900.pdf?src-supplier=Conrad; ComponentLink2Description: https://datasheet.ciiva.com/29199/454082-da-01-en-vs-kondensator-0805-29199900.pdf?src-supplier=Conrad; ComponentLink3Description: Link Original; ComponentLink3URL: https://www.digikey.com/en/products/detail/samsung-electro-mechanics/CL21C101JBANNNC/3886672; ComponentLink4Description: Link Cross; ComponentLink4URL: https://www.lcsc.com/product-detail/Multilayer-Ceramic-Capacitors-MLCC-SMD-SMT_Samsung-Electro-Mechanics-CL21C101JBANNNC_C1790.html?s_z=n_CL21C101JBANNNC; ComponentLink5Description: Link Viet Nam; ComponentLink5URL: https://linhkien.cxtvn.com/3499-tu-330-33pf-0805-50v-10c.html; Supplier Part Number 1: 1276-1014-1-ND
C63 = CAP ALUM 220UF 20% 35V SMD: MF: Panasonic; MP: EEEFKC221XAL; SnapEDA_Link: https://www.snapeda.com/parts/EEEFKC221XAL/Panasonic/view-part/?ref=snap; Package: RADIAL-2 Panasonic; Value: *; Check_prices: https://www.snapeda.com/parts/EEEFKC221XAL/Panasonic/view-part/?ref=eda
C64 C83 C85 = CAP ALUM 220UF 20% 16V SMD: MF: Panasonic; MP: EEEFKC221XAL; SnapEDA_Link: https://www.snapeda.com/parts/EEEFKC221XAL/Panasonic/view-part/?ref=snap; Package: RADIAL-2 Panasonic; Value: *; Check_prices: https://www.snapeda.com/parts/EEEFKC221XAL/Panasonic/view-part/?ref=eda
CN1 = 2P-2.54
CN2 = CONN_TH; TERMINAL_12P_9.5MM: 12 Position Terminal Block 25A; Manufacturer: Phoenix Contact; Manufacturer Part Number: MC1.5/6-G-3.81; LIBRARY MADE BY: MR. XUAN SIEU; Supplier 1: Digikey; RoHS: Yes; Stock 1: 4606; Pricing 1: 1=2.84, 10=2.015, 25=1.832, 50=1.8256 (USD); ComponentLink1URL: https://datasheet.octopart.com/MC-1%2C5/-6-G-3%2C81-Phoenix-Contact-datasheet-529459.pdf?src-supplier=Element14; ComponentLink1Description: https://datasheet.octopart.com/MC-1%2C5/-6-G-3%2C81-Phoenix-Contact-datasheet-529459.pdf?src-supplier=Element14; ComponentLink2URL: https://datasheet.octopart.com/1803316-Phoenix-Contact-datasheet-76709.pdf?src-supplier=Digikey; ComponentLink2Description: https://datasheet.octopart.com/1803316-Phoenix-Contact-datasheet-76709.pdf?src-supplier=Digikey; ComponentLink3URL: https://datasheet.octopart.com/1803316-Phoenix-Contact-datasheet-39076.pdf?src-supplier=Today+Components; ComponentLink3Description: https://datasheet.octopart.com/1803316-Phoenix-Contact-datasheet-39076.pdf?src-supplier=Today+Components; LINK VIET NAM: https://linhkien.cxtvn.com/4817-cau-dau-15edg381-381mm-xanh-cong-mau-nhat.html; LINK ORIGINAL: https://www.digikey.com/en/products/detail/phoenix-contact/1803316/260578; Supplier Part Number 1: 277-1210-ND
D6 = DIODE,SMD;DF2S6,TVS,9V: 9V (Typ) Clamp 1A (8/20¦Ìs) Ipp Tvs Diode Surface Mount SOD-923; Manufacturer Cross: Toshiba; Manufacturer Part Number: DF2S6.8FS,L3M; Number of Unidirectional Channels: 1; Reverse Standoff Voltage: 5V; Min Breakdown Voltage: 6.4V; Power Line Protection: No; Diode Type: ZENER; LIBRARY MADE BY: MR. XUAN SIEU; Supplier 1: Digikey; RoHS: No; Category: TVS Diodes; Stock 1: 462569; Pricing 1: 1=0.1, 10=0.068, 100=0.025, 500=0.023, 1000=0.021, 2000=0.0205, 5000=0.02 (USD); Mount: Surface Mount; Packaging: Cut Tape; Peak Pulse Current: 1A; Series: -; RoHS Compliant: No; ComponentLink1URL: http://www.mouser.com/ds/2/408/DF2S6.8FS_datasheet_en_20140709-708755.pdf?src-supplier=Mouser; ComponentLink1Description: http://www.mouser.com/ds/2/408/DF2S6.8FS_datasheet_en_20140709-708755.pdf?src-supplier=Mouser; ComponentLink2URL: https://toshiba.semicon-storage.com/info/docget.jsp?did=22219&prodName=DF2S6.8FS&src-supplier=Digikey; ComponentLink2Description: https://toshiba.semicon-storage.com/info/docget.jsp?did=22219&prodName=DF2S6.8FS&src-supplier=Digikey; ComponentLink3Description: Link Original; ComponentLink3URL: https://www.digikey.com/en/products/detail/toshiba-semiconductor-and-storage/DF2S6-8FS-L3M/3191286?s=N4IgTCBcDaICIDEwGUBsA6AHA5IC6AvkA; ComponentLink4Description: Link Cross; ComponentLink4URL: https://www.lcsc.com/product-detail/ESD-and-Surge-Protection-TVS-ESD_TOSHIBA-DF2S6-8FS-L3M_C1972978.html?s_z=n_DF2S6.8FS%252CL3M; ComponentLink5Description: Link Viet Nam; ComponentLink5URL: N/A; Supplier Part Number 1: DF2S6.8FS(TL4D)CT-ND
D7 D9 = LED_SMD;0805,AMBER: WL-SMCW Mono-color Chip LED Waterclear, SMT, size 0805, Amber, 2V, 140°; Manufacturer Part Number: 150080AS75000; Manufacturer: Wurth Elektronik; Case/Size Code: 0805; Chip Technology: AlInGaP; Dominant Wavelength: 605nm; Luminous Intensity: 130mcd; Peak Wavelength: 610nm; LIBRARY MADE BY: MR. XUAN SIEU; Category: Signal LEDs; Match Code: WL-SMCW; ComponentLink1Description: Website Link; ComponentLink1URL: https://www.we-online.com/redexpert/article/150080AS75000?ad; ComponentLink2Description: Datasheet Link; ComponentLink2URL: https://www.we-online.com/redexpert/spec/150080AS75000?ad; Mount: Surface Mount; Operating Temperature Max: 85°C; Operating Temperature Min: -40°C; Packaging: Tape and Reel; Length: 2mm; Width: 1.25mm; Height: 0.7mm; Emitting Color: Amber; Forward Voltage: 2V; Viewing Angle: 140°; Link Viet Nam: https://linhkien.cxtvn.com/6190-led-0805-cac-mau.html
D8 = DIODE,SMD;DF2S6,TVS,9V_1: 9V (Typ) Clamp 1A (8/20¦Ìs) Ipp Tvs Diode Surface Mount SOD-923; Manufacturer Cross: Toshiba; Manufacturer Part Number: DF2S6.8FS,L3M; Number of Unidirectional Channels: 1; Reverse Standoff Voltage: 5V; Min Breakdown Voltage: 6.4V; Power Line Protection: No; Diode Type: ZENER; LIBRARY MADE BY: MR. XUAN SIEU; Supplier 1: Digikey; RoHS: No; Category: TVS Diodes; Stock 1: 462569; Pricing 1: 1=0.1, 10=0.068, 100=0.025, 500=0.023, 1000=0.021, 2000=0.0205, 5000=0.02 (USD); Mount: Surface Mount; Packaging: Cut Tape; Peak Pulse Current: 1A; Series: -; RoHS Compliant: No; ComponentLink1URL: http://www.mouser.com/ds/2/408/DF2S6.8FS_datasheet_en_20140709-708755.pdf?src-supplier=Mouser; ComponentLink1Description: http://www.mouser.com/ds/2/408/DF2S6.8FS_datasheet_en_20140709-708755.pdf?src-supplier=Mouser; ComponentLink2URL: https://toshiba.semicon-storage.com/info/docget.jsp?did=22219&prodName=DF2S6.8FS&src-supplier=Digikey; ComponentLink2Description: https://toshiba.semicon-storage.com/info/docget.jsp?did=22219&prodName=DF2S6.8FS&src-supplier=Digikey; ComponentLink3Description: Link Original; ComponentLink3URL: https://www.digikey.com/en/products/detail/toshiba-semiconductor-and-storage/DF2S6-8FS-L3M/3191286?s=N4IgTCBcDaICIDEwGUBsA6AHA5IC6AvkA; ComponentLink4Description: Link Cross; ComponentLink4URL: https://www.lcsc.com/product-detail/ESD-and-Surge-Protection-TVS-ESD_TOSHIBA-DF2S6-8FS-L3M_C1972978.html?s_z=n_DF2S6.8FS%252CL3M; ComponentLink5Description: Link Viet Nam; ComponentLink5URL: N/A; Supplier Part Number 1: DF2S6.8FS(TL4D)CT-ND
D10-D15 = LED_SMD;0805,RED: WL-SMCW Mono-color Chip LED Waterclear, SMT, size 0805, Red, 2V, 140°; Manufacturer Part Number: 150080RS75000; Manufacturer: Wurth Elektronik; Case/Size Code: 0805; Chip Technology: AlInGaP; Dominant Wavelength: 625nm; Luminous Intensity: 150mcd; Peak Wavelength: 630nm; LIBRARY MADE BY: MR. XUAN SIEU; Category: Signal LEDs; Match Code: WL-SMCW; ComponentLink1Description: Website Link; ComponentLink1URL: https://www.we-online.com/redexpert/article/150080RS75000?ad; ComponentLink2Description: Datasheet Link; ComponentLink2URL: https://www.we-online.com/redexpert/spec/150080RS75000?ad; Mount: Surface Mount; Operating Temperature Max: 85°C; Operating Temperature Min: -40°C; Packaging: Tape and Reel; Length: 2mm; Width: 1.25mm; Height: 0.7mm; Emitting Color: Red; Forward Voltage: 2V; Viewing Angle: 140°; Link Viet Nam: https://linhkien.cxtvn.com/6190-led-0805-cac-mau.html
DEBUG1 = JP1X6-P2.54-TH: Pin Header Single Row 2.54MM 6P - Through Hole
EC4-EC6 = CAP_ALU_SMD; 100UF 20% 16V 6.3x5.5MM: 100 µF 16 V Aluminum Electrolytic Capacitors Radial, Can - SMD 2000 Hrs @ 105°C; Manufacturer: Wurth Electronics; Manufacturer Part Number: 865060343005; Insulation Resistance: 1MR; Ripple Current: 255mA; ESR (Equivalent Series Resistance): 393.664mR; Leakage Current: 16uA; LIBRARY MADE BY: MR. XUAN SIEU; Supplier 1: Digikey; RoHS: No; Category: Aluminum Electrolytic Capacitors; Stock 1: 6119; Pricing 1: 1=0.3, 50=0.255, 100=0.222, 250=0.197, 500=0.173 (USD); Voltage Rating (DC): 16V; Length: 5.5mm; ComponentLink1URL: http://www.farnell.com/datasheets/1880038.pdf?src-supplier=Farnell; ComponentLink1Description: http://www.farnell.com/datasheets/1880038.pdf?src-supplier=Farnell; ComponentLink2URL: https://katalog.we-online.de/pbs/datasheet/865060343005.pdf?src-supplier=Digikey; ComponentLink2Description: https://katalog.we-online.de/pbs/datasheet/865060343005.pdf?src-supplier=Digikey; ComponentLink3URL: http://www.farnell.com/datasheets/1880038.pdf?src-supplier=Newark; ComponentLink3Description: http://www.farnell.com/datasheets/1880038.pdf?src-supplier=Newark; ComponentLink4URL: http://www.farnell.com/datasheets/1880038.pdf?src-supplier=Element14; ComponentLink4Description: http://www.farnell.com/datasheets/1880038.pdf?src-supplier=Element14; LINK ORIGINAL: https://www.digikey.com/en/products/detail/w%C3%BCrth-elektronik/865060343005/5728117; LINK VIET NAM: https://linhkien.cxtvn.com/2034-tu-nhom-100uf-16v-63x54mm.html; Supplier Part Number 1: 732-8522-6-ND
IC2 = IC_SMD; IC RTC CLK/CALENDAR_I2C; 16SOIC; DS3231SN: IC Rtc Clk/calendar I2C 16-SOIC; Manufacturer: Maxim; Max Supply Voltage: 5.5V; Min Supply Voltage: 2.3V; Logic Function: Clock; Time Format: HH:MM:SS; Operating Supply Voltage: 3.3V; Interface: I2C,Serial,2-Wire; Date Format: YY-MM-DD-dd; LIBRARY MADE BY: MR. XUAN SIEU; Supplier 1: Digikey; Manufacturer Part Number: DS3231SN#T&R; RoHS: Yes; Category: Real Time Clocks; Stock 1: 1977; Pricing 1: 1=12.82, 10=10.089, 25=9.4052, 100=8.6535, 250=8.2952, 500=8.07934 (USD); Mount: Surface Mount; Case/Package: SOIC; Number of Pins: 16; Min Operating Temperature: -40°C; Max Operating Temperature: 85°C; Packaging: Tape and Reel; Package Quantity: 1000; Series: -; Radiation Hardening: No; Lead Free: Lead Free; RoHS Compliant: Yes; Supplier Part Number 1: DS3231SN#T&RDKR-ND; LINK VIET NAM: https://linhkien.cxtvn.com/3008-ds3231sn-ds3231-sop-16.html; LINK ORIGINAL: https://www.digikey.com/en/products/detail/analog-devices-inc-maxim-integrated/DS3231SN-T-R/1197577
J1 = MSIM-2-A: Micro SIM Card Connector, 6 Positions, Connector and Ejector, Push In, Auto Eject Out, Surface Mount, 1.37 mm Height Above Board, Gold Flash; MF: Same Sky; SnapEDA_Link: https://www.snapeda.com/parts/MSIM-2-A/Same+Sky/view-part/?ref=snap; Package: None; Value: *; MP: MSIM-2-A; Check_prices: https://www.snapeda.com/parts/MSIM-2-A/Same+Sky/view-part/?ref=eda
J2 = IDE_14P_2.54MM: Conn Shrouded Header (4 Sides) HDR 14 POS 2.54mm Solder ST Top Entry Thru-Hole C-GridÂ® Tray; MF: Molex; MP: 702461404; SnapEDA_Link: https://www.snapeda.com/parts/702461404/Molex/view-part/?ref=snap; Package: None; Value: *; Check_prices: https://www.snapeda.com/parts/702461404/Molex/view-part/?ref=eda
J3 = TERMINAL_7P_5.08: 7 Position Terminal Block Header, Male Pins, Shrouded (4 Side) 0.197 (5.00mm) 90°, Right Angle - Through Hole; MF: TE Connectivity; MP: 796644-7; SnapEDA_Link: https://www.snapeda.com/parts/796644-7/TE+Connectivity/view-part/?ref=snap; Package: None; Value: *; EU_RoHS_Compliance: Compliant; Check_prices: https://www.snapeda.com/parts/796644-7/TE+Connectivity/view-part/?ref=eda
JP1 = Con7: Connector 7; Value: Connector 7
K1-K5 = Relay_4P_30A_1: 27.4 x 31.8 x 20 mm, 24 V, 30 A, SPST (1 Form A), Power Relay; MF: Same Sky; MP: PR23-24V-900-1A; SnapEDA_Link: https://www.snapeda.com/parts/PR23-24V-900-1A/Same+Sky/view-part/?ref=snap; Package: None; Value: *; Check_prices: https://www.snapeda.com/parts/PR23-24V-900-1A/Same+Sky/view-part/?ref=eda
L4-L7 = Ferrite Bead: Code_IEC: 1005; Value: 1K; Published: 8-Jun-2000; LatestRevisionDate: 29-May-2009; LatestRevisionNote: IPC-7351 Footprint Added.; Publisher: Altium Limited; PackageDescription: Chip Inductor; Code_JEITA: 0402
M1 = MODULE_SMD; MODULE SIM 4G, A7680C_CHIP: Cellular module; LTE Cat1 bis; GNSS (option); MP: SIM868; MF: MikroElektronika; LIBRARY MADE BY: MR. XUAN SIEU; Check_prices: https://www.snapeda.com/parts/SIM868/MikroElektronika/view-part/?ref=eda; Value: *; Availability: Not in stock; Price: None; Package: None; SnapEDA_Link: https://www.snapeda.com/parts/SIM868/MikroElektronika/view-part/?ref=snap; LINK VIET NAM: https://www.lazada.vn/products/bo-dieu-khien-simcom-a7680c-cat1-kich-thuoc-nho-tuong-thich-voi-sim800c-toan-cau-4g-lte-ho-tro-giao-thuc-tcpip-co-the-goi-dien-thoai-i2831789045.html?srsltid=AfmBOoosQrxJde6jj3jMc_vCVE_fzO6UQJ8IH7P6YqoQoCxdnF-xPq5n; LINK ORIGINAL: https://cn.simcom.com/product/A7680C.html